# Altium schematic sheet A313_5.SchDoc
size 1071 x 817 mm
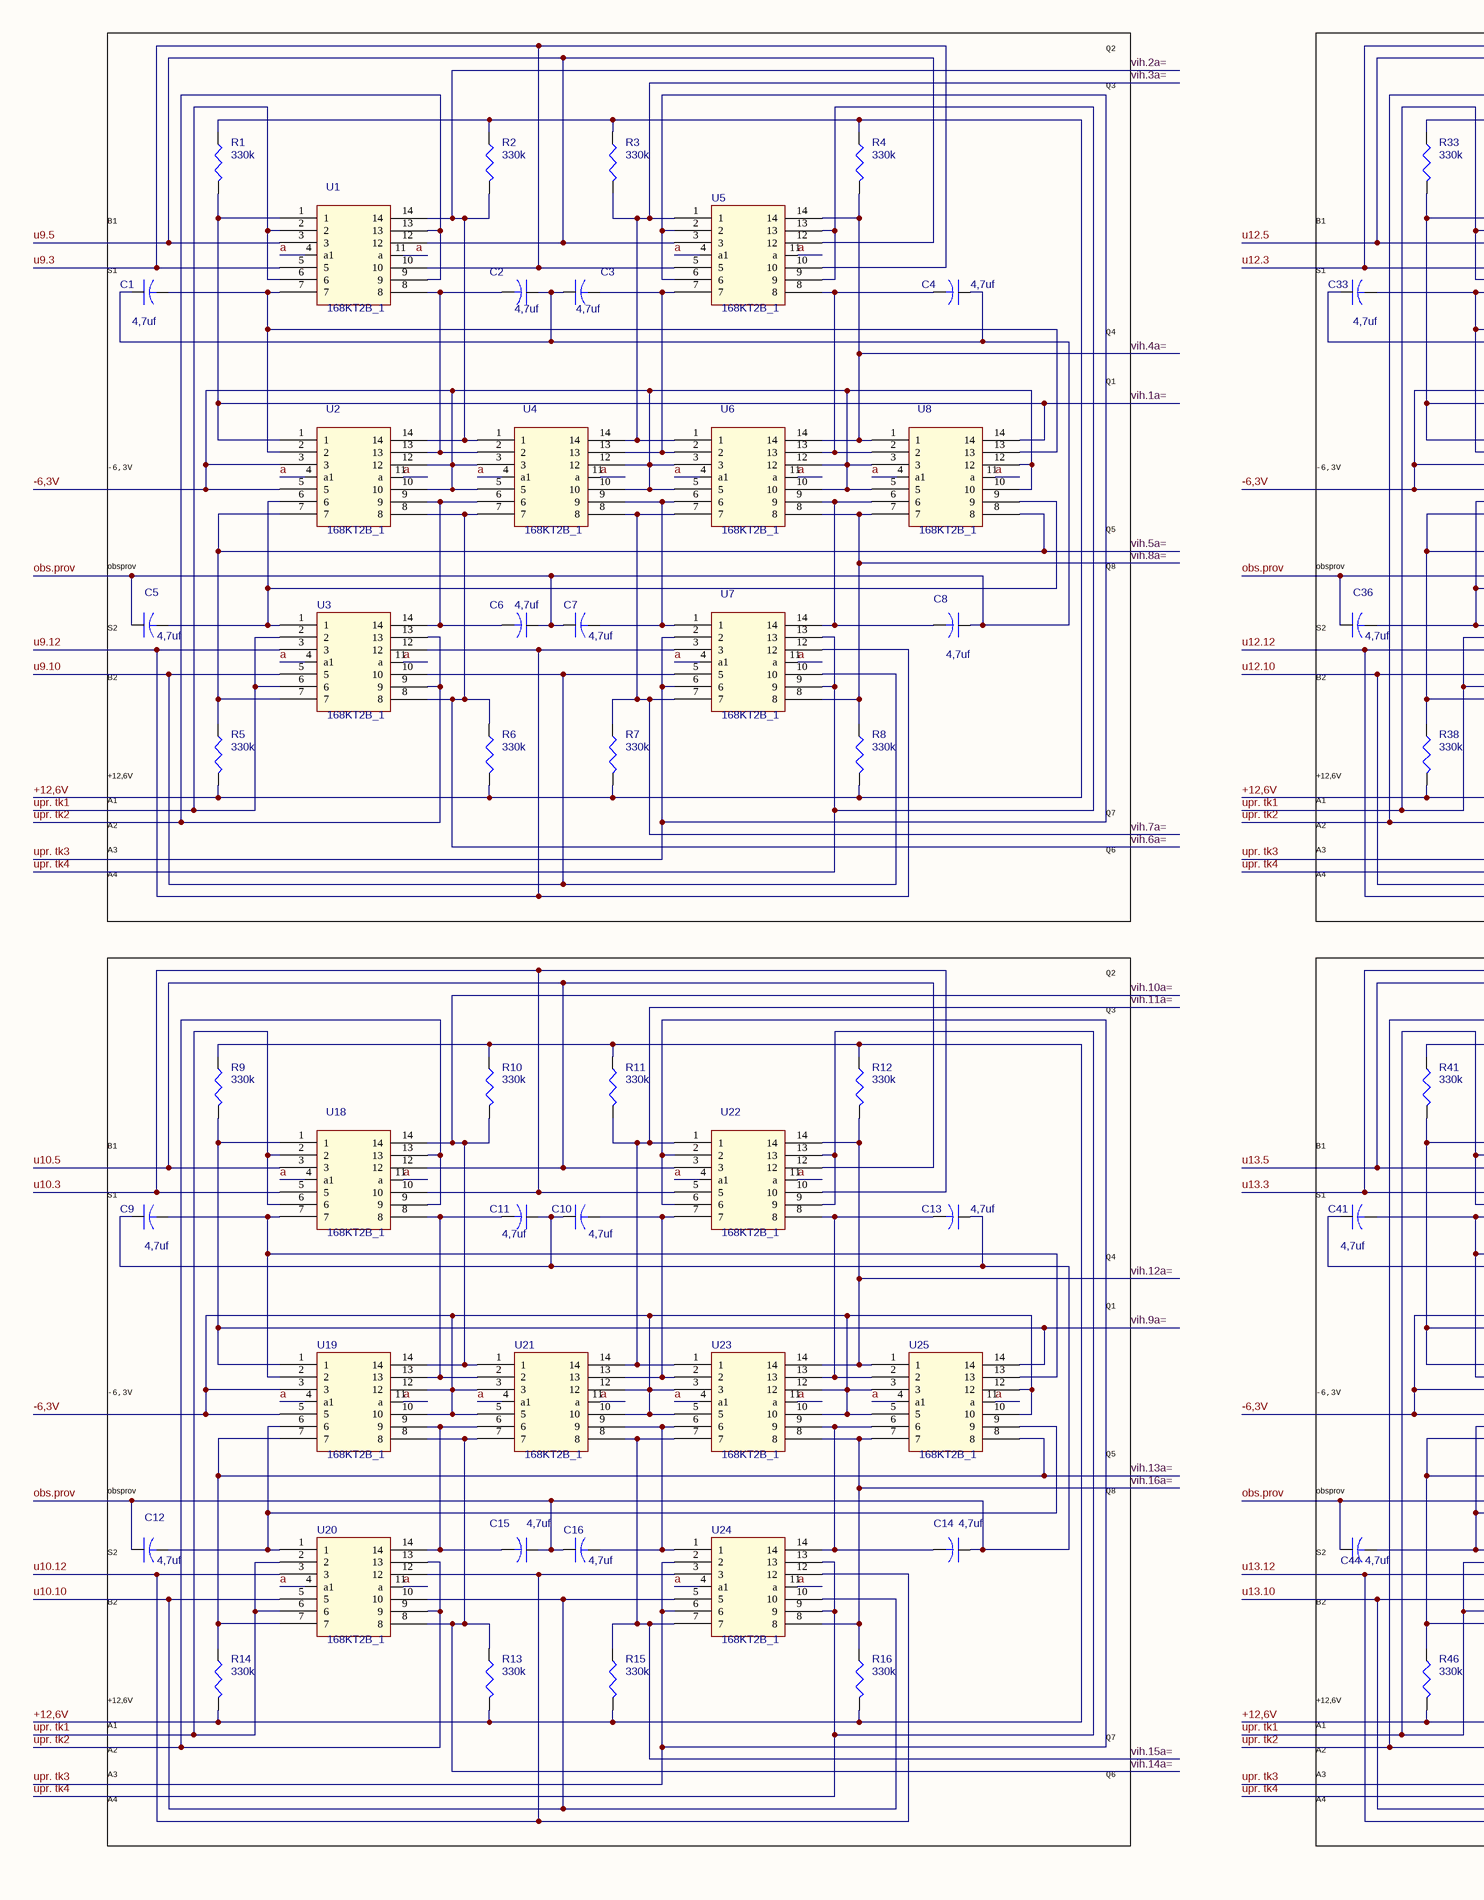
[diagram p0: A313_5.SchDoc, top left]
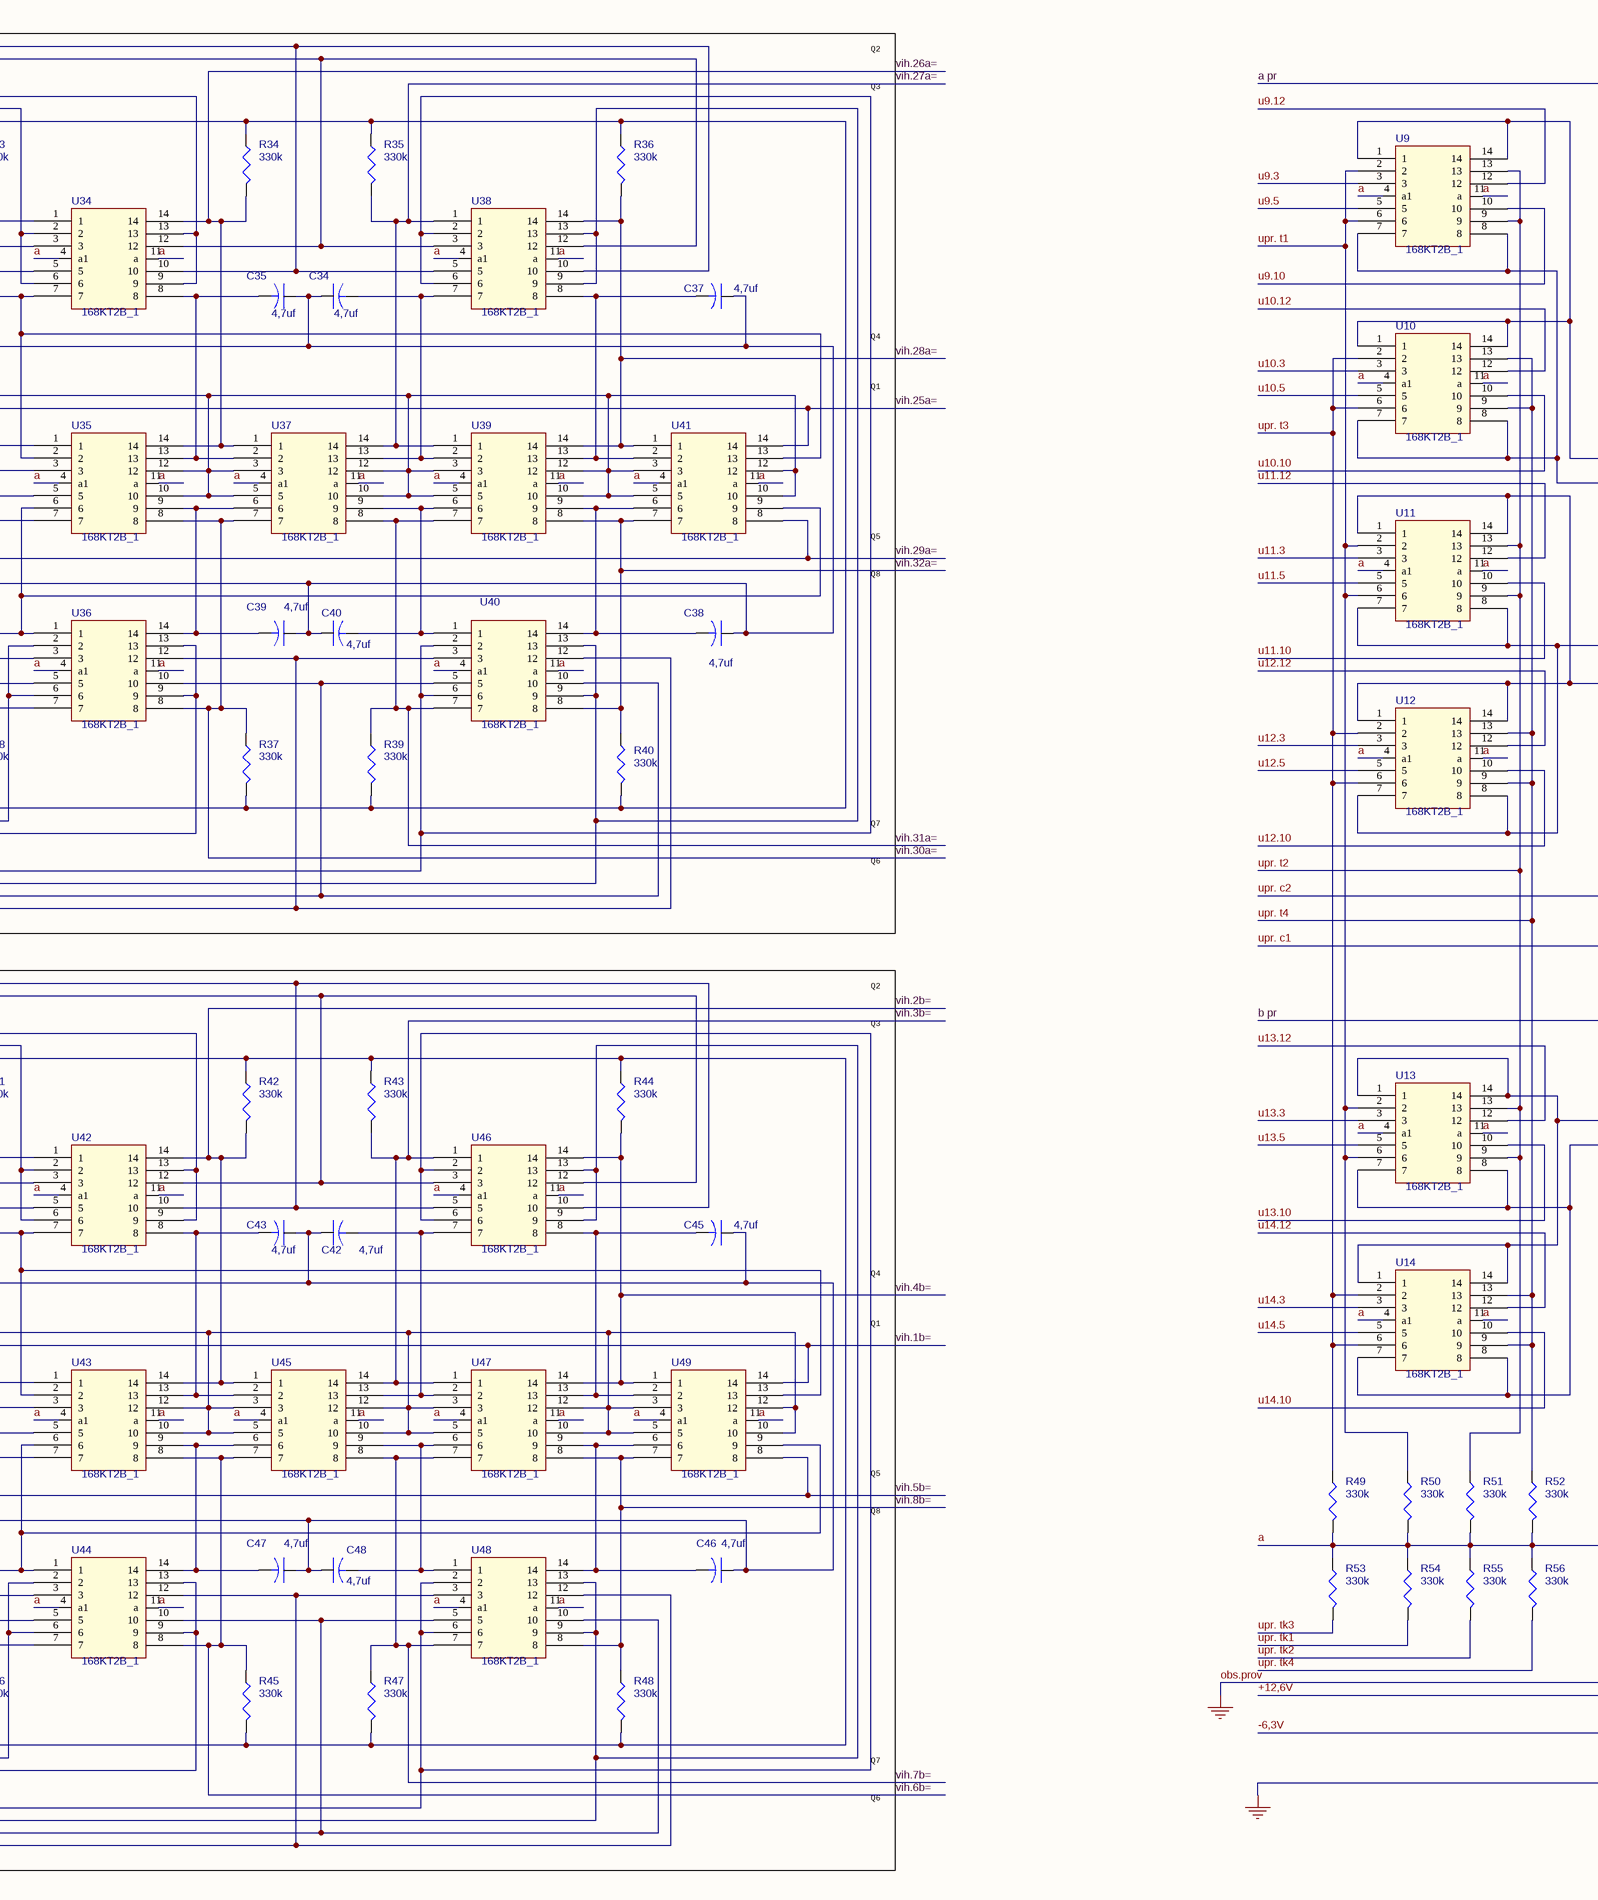
[diagram p1: A313_5.SchDoc, top middle]
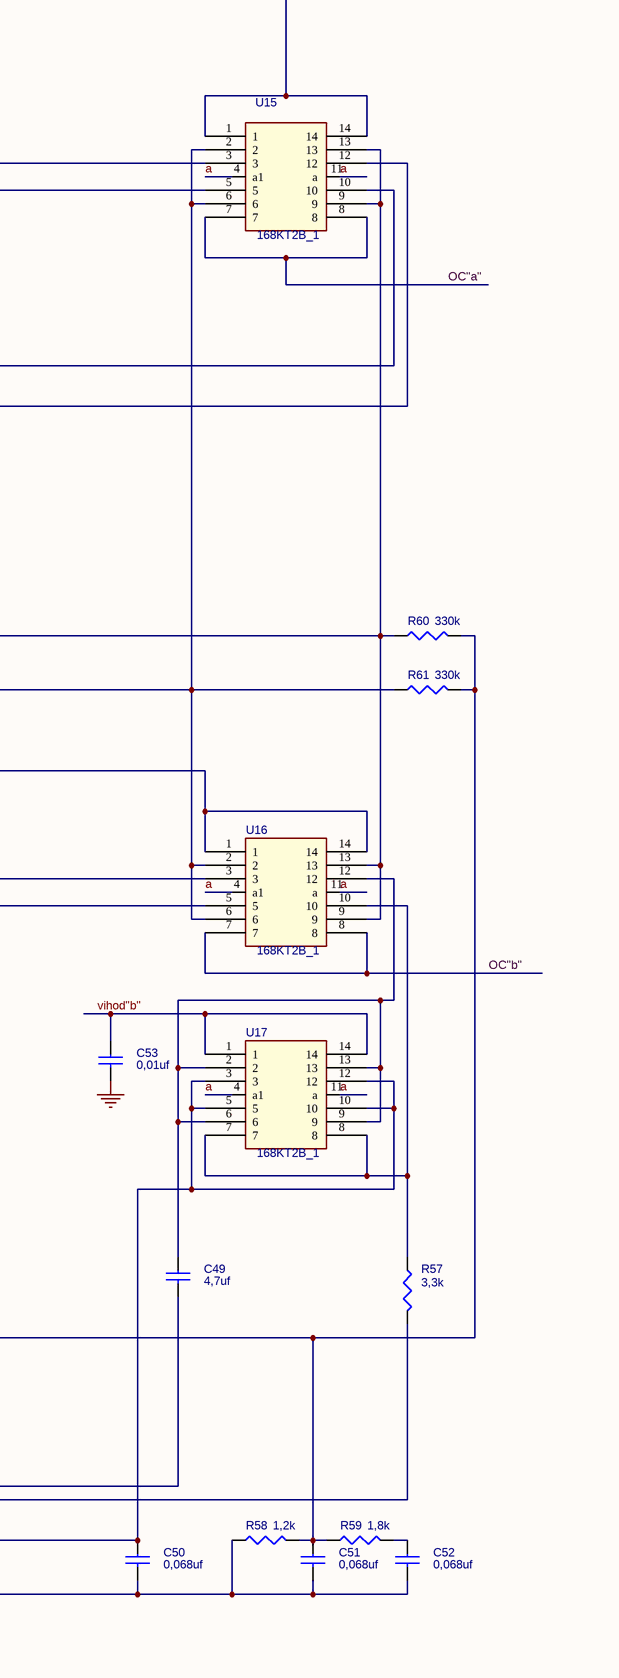
[diagram p2: A313_5.SchDoc, top right]
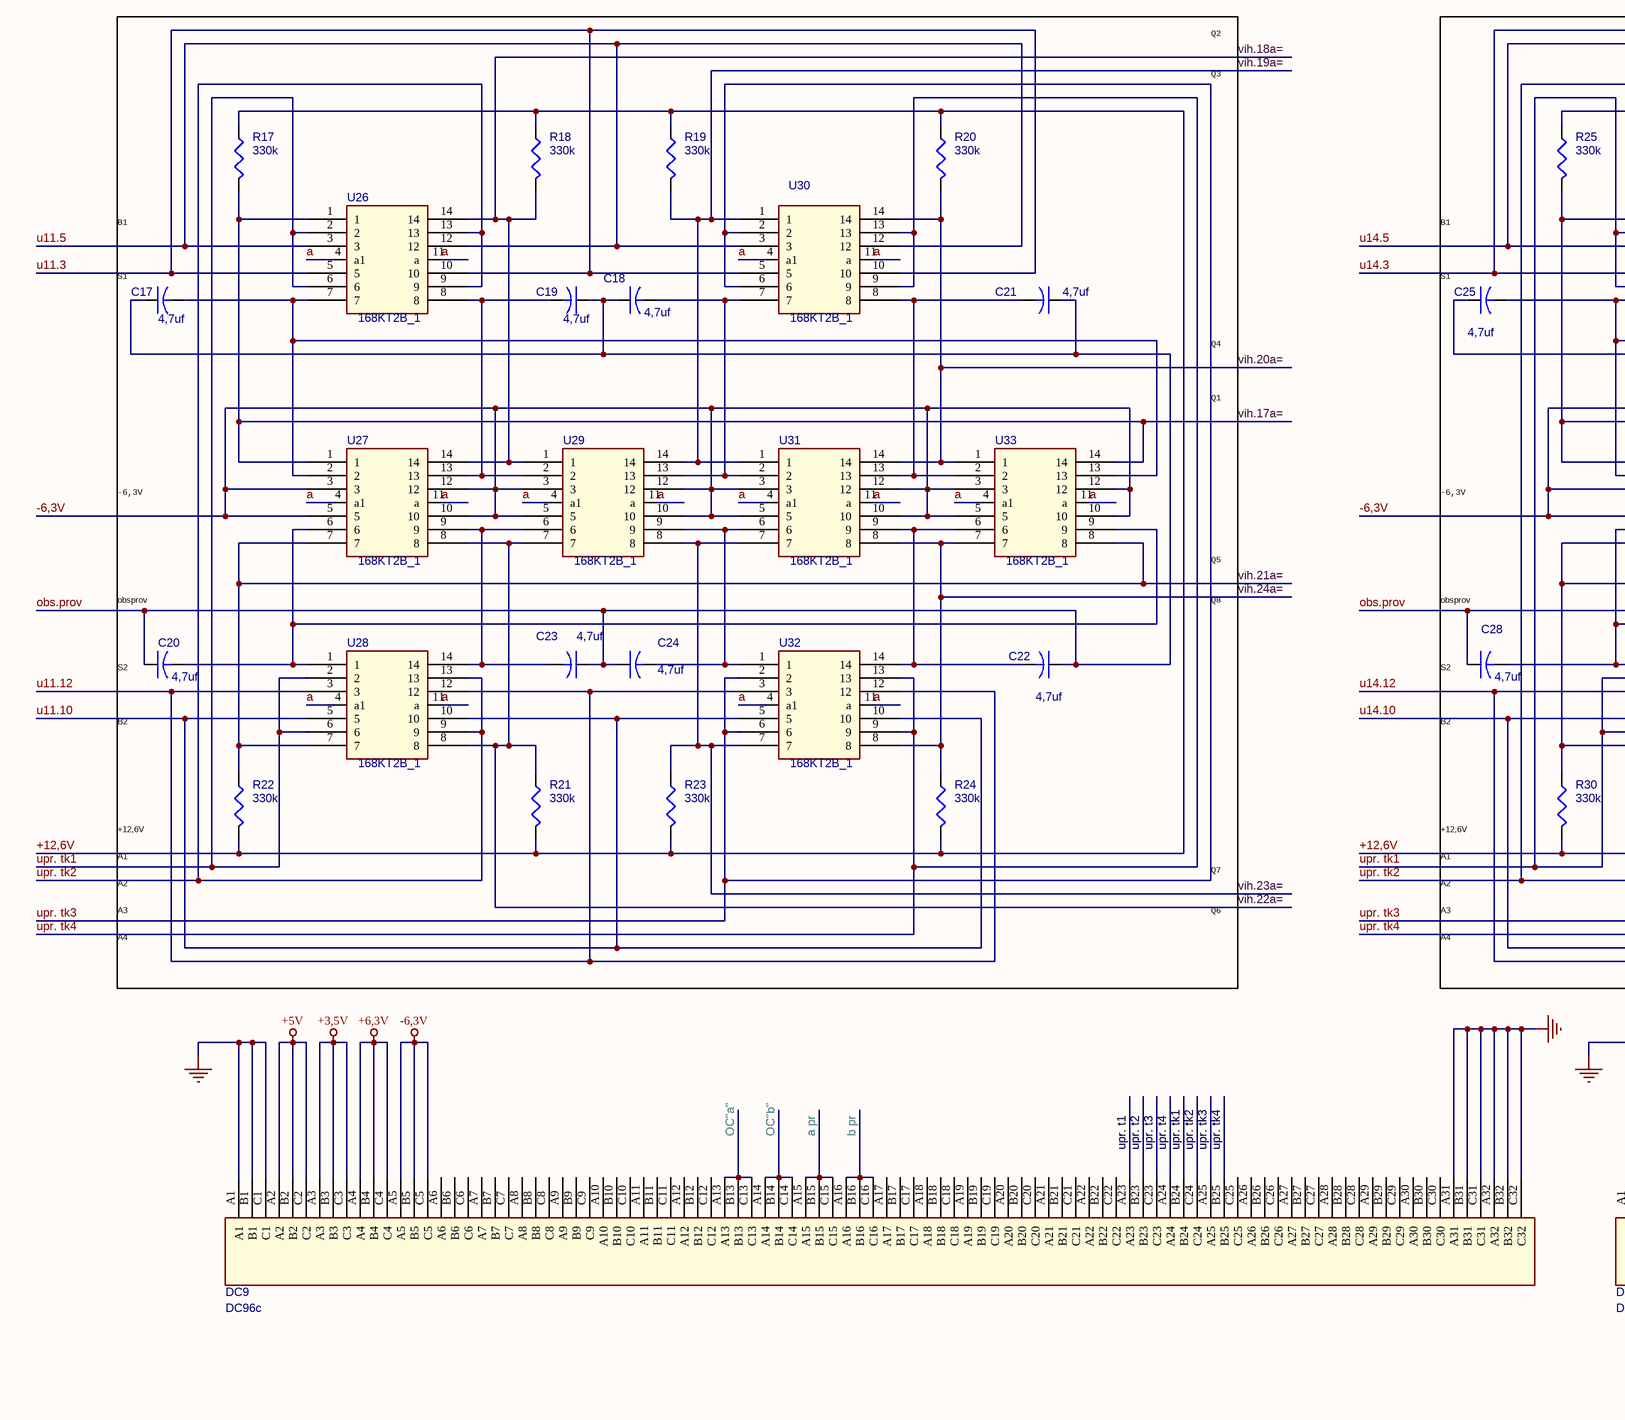
[diagram p3: A313_5.SchDoc, bottom left]
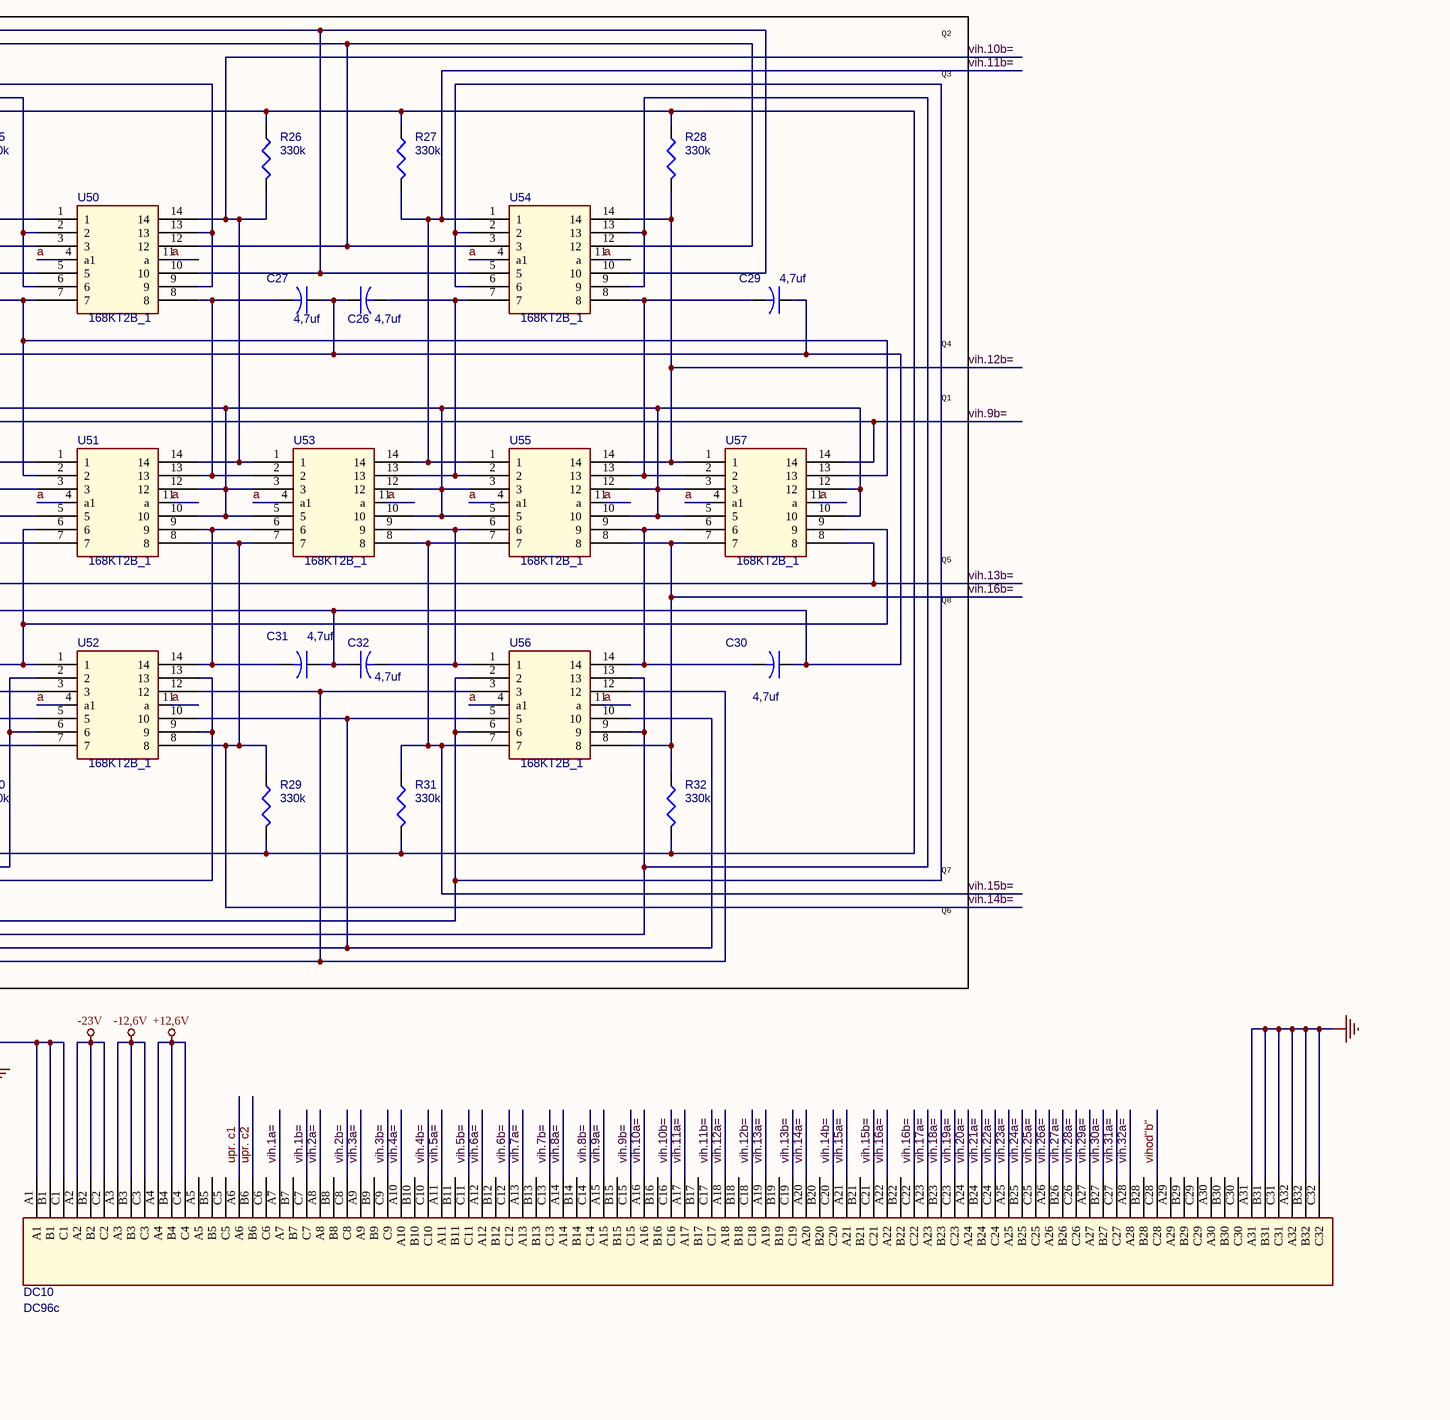
[diagram p4: A313_5.SchDoc, bottom middle]
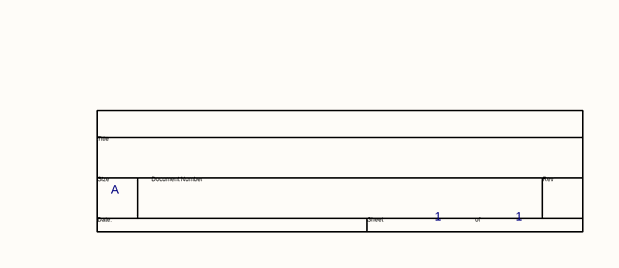
[diagram p5: A313_5.SchDoc, bottom right]

## Parts
*  Page Count: 1  Page Size: A  (hidden comment: TitleBlock0)  (graphical)
C1  4,7uf  [1206]
C2  4,7uf  [1206]
C3  4,7uf  [1206]
C4  4,7uf  [1206]
C5  4,7uf  [1206]
C6  4,7uf  [1206]
C7  4,7uf  [1206]
C8  4,7uf  [1206]
C9  4,7uf  [1206]
C10  4,7uf  [1206]
C11  4,7uf  [1206]
C12  4,7uf  [1206]
C13  4,7uf  [1206]
C14  4,7uf  [1206]
C15  4,7uf  [1206]
C16  4,7uf  [1206]
C17  4,7uf  [1206]
C18  4,7uf  [1206]
C19  4,7uf  [1206]
C20  4,7uf  [1206]
C21  4,7uf  [1206]
C22  4,7uf  [1206]
C23  4,7uf  [1206]
C24  4,7uf  [1206]
C25  4,7uf  [1206]
C26  4,7uf  [1206]
C27  4,7uf  [1206]
C28  4,7uf  [1206]
C29  4,7uf  [1206]
C30  4,7uf  [1206]
C31  4,7uf  [1206]
C32  4,7uf  [1206]
C33  4,7uf  [1206]
C34  4,7uf  [1206]
C35  4,7uf  [1206]
C36  4,7uf  [1206]
C37  4,7uf  [1206]
C38  4,7uf  [1206]
C39  4,7uf  [1206]
C40  4,7uf  [1206]
C41  4,7uf  [1206]
C42  4,7uf  [1206]
C43  4,7uf  [1206]
C44  4,7uf  [1206]
C45  4,7uf  [1206]
C46  4,7uf  [1206]
C47  4,7uf  [1206]
C48  4,7uf  [1206]
C49  4,7uf  [1206]
C50  0,068uf  [C0805]
C51  0,068uf  [C0805]
C52  0,068uf  [C0805]
C53  0,01uf  [C0805]
DC9  DC96c  [DC96c_DUC]
DC10  DC96c  [DC96c_DUC]
R1  330k  [6-0805_N]
R2  330k  [6-0805_N]
R3  330k  [6-0805_N]
R4  330k  [6-0805_N]
R5  330k  [6-0805_N]
R6  330k  [6-0805_N]
R7  330k  [6-0805_N]
R8  330k  [6-0805_N]
R9  330k  [6-0805_N]
R10  330k  [6-0805_N]
R11  330k  [6-0805_N]
R12  330k  [6-0805_N]
R13  330k  [6-0805_N]
R14  330k  [6-0805_N]
R15  330k  [6-0805_N]
R16  330k  [6-0805_N]
R17  330k  [6-0805_N]
R18  330k  [6-0805_N]
R19  330k  [6-0805_N]
R20  330k  [6-0805_N]
R21  330k  [6-0805_N]
R22  330k  [6-0805_N]
R23  330k  [6-0805_N]
R24  330k  [6-0805_N]
R25  330k  [6-0805_N]
R26  330k  [6-0805_N]
R27  330k  [6-0805_N]
R28  330k  [6-0805_N]
R29  330k  [6-0805_N]
R30  330k  [6-0805_N]
R31  330k  [6-0805_N]
R32  330k  [6-0805_N]
R33  330k  [6-0805_N]
R34  330k  [6-0805_N]
R35  330k  [6-0805_N]
R36  330k  [6-0805_N]
R37  330k  [6-0805_N]
R38  330k  [6-0805_N]
R39  330k  [6-0805_N]
R40  330k  [6-0805_N]
R41  330k  [6-0805_N]
R42  330k  [6-0805_N]
R43  330k  [6-0805_N]
R44  330k  [6-0805_N]
R45  330k  [6-0805_N]
R46  330k  [6-0805_N]
R47  330k  [6-0805_N]
R48  330k  [6-0805_N]
R49  330k  [6-0805_N]
R50  330k  [6-0805_N]
R51  330k  [6-0805_N]
R52  330k  [6-0805_N]
R53  330k  [6-0805_N]
R54  330k  [6-0805_N]
R55  330k  [6-0805_N]
R56  330k  [6-0805_N]
R57  3,3k  [6-0805_N]
R58  1,2k  [6-0805_N]
R59  1,8k  [6-0805_N]
R60  330k  [6-0805_N]
R61  330k  [6-0805_N]
U1  168KT2B_1  [168KT2B]
U2  168KT2B_1  [168KT2B]
U3  168KT2B_1  [168KT2B]
U4  168KT2B_1  [168KT2B]
U5  168KT2B_1  [168KT2B]
U6  168KT2B_1  [168KT2B]
U7  168KT2B_1  [168KT2B]
U8  168KT2B_1  [168KT2B]
U9  168KT2B_1  [168KT2B]
U10  168KT2B_1  [168KT2B]
U11  168KT2B_1  [168KT2B]
U12  168KT2B_1  [168KT2B]
U13  168KT2B_1  [168KT2B]
U14  168KT2B_1  [168KT2B]
U15  168KT2B_1  [168KT2B]
U16  168KT2B_1  [168KT2B]
U17  168KT2B_1  [168KT2B]
U18  168KT2B_1  [168KT2B]
U19  168KT2B_1  [168KT2B]
U20  168KT2B_1  [168KT2B]
U21  168KT2B_1  [168KT2B]
U22  168KT2B_1  [168KT2B]
U23  168KT2B_1  [168KT2B]
U24  168KT2B_1  [168KT2B]
U25  168KT2B_1  [168KT2B]
U26  168KT2B_1  [168KT2B]
U27  168KT2B_1  [168KT2B]
U28  168KT2B_1  [168KT2B]
U29  168KT2B_1  [168KT2B]
U30  168KT2B_1  [168KT2B]
U31  168KT2B_1  [168KT2B]
U32  168KT2B_1  [168KT2B]
U33  168KT2B_1  [168KT2B]
U34  168KT2B_1  [168KT2B]
U35  168KT2B_1  [168KT2B]
U36  168KT2B_1  [168KT2B]
U37  168KT2B_1  [168KT2B]
U38  168KT2B_1  [168KT2B]
U39  168KT2B_1  [168KT2B]
U40  168KT2B_1  [168KT2B]
U41  168KT2B_1  [168KT2B]
U42  168KT2B_1  [168KT2B]
U43  168KT2B_1  [168KT2B]
U44  168KT2B_1  [168KT2B]
U45  168KT2B_1  [168KT2B]
U46  168KT2B_1  [168KT2B]
U47  168KT2B_1  [168KT2B]
U48  168KT2B_1  [168KT2B]
U49  168KT2B_1  [168KT2B]
U50  168KT2B_1  [168KT2B]
U51  168KT2B_1  [168KT2B]
U52  168KT2B_1  [168KT2B]
U53  168KT2B_1  [168KT2B]
U54  168KT2B_1  [168KT2B]
U55  168KT2B_1  [168KT2B]
U56  168KT2B_1  [168KT2B]
U57  168KT2B_1  [168KT2B]

## Nets
+3,5V: DC9.A3 DC9.B3 DC9.C3
+5V: DC9.A2 DC9.B2 DC9.C2
+6,3V: DC9.A4 DC9.B4 DC9.C4
+12,6V: DC10.A4 DC10.B4 DC10.C4 R1.1 R2.1 R3.1 R4.1 R5.2 R6.2 R7.2 R8.2 R9.1 R10.1 R11.1 R12.1 R13.2 R14.2 R15.2 R16.2 R17.1 R18.1 R19.1 R20.1 R21.2 R22.2 R23.2 R24.2 R25.1 R26.1 R27.1 R28.1 R29.2 R30.2 R31.2 R32.2 R33.1 R34.1 R35.1 R36.1 R37.2 R38.2 R39.2 R40.2 R41.1 R42.1 R43.1 R44.1 R45.2 R46.2 R47.2 R48.2 R57.2
-6,3V: C50.1 DC9.A5 DC9.B5 DC9.C5 U2.3 U2.5 U2.10 U2.12 U4.3 U4.5 U4.10 U4.12 U6.3 U6.5 U6.10 U6.12 U8.3 U8.5 U8.10 U8.12 U17.3 U17.5 U17.10 U17.12 U19.3 U19.5 U19.10 U19.12 U21.3 U21.5 U21.10 U21.12 U23.3 U23.5 U23.10 U23.12 U25.3 U25.5 U25.10 U25.12 U27.3 U27.5 U27.10 U27.12 U29.3 U29.5 U29.10 U29.12 U31.3 U31.5 U31.10 U31.12 U33.3 U33.5 U33.10 U33.12 U35.3 U35.5 U35.10 U35.12 U37.3 U37.5 U37.10 U37.12 U39.3 U39.5 U39.10 U39.12 U41.3 U41.5 U41.10 U41.12 U43.3 U43.5 U43.10 U43.12 U45.3 U45.5 U45.10 U45.12 U47.3 U47.5 U47.10 U47.12 U49.3 U49.5 U49.10 U49.12 U51.3 U51.5 U51.10 U51.12 U53.3 U53.5 U53.10 U53.12 U55.3 U55.5 U55.10 U55.12 U57.3 U57.5 U57.10 U57.12
-12,6V: DC10.A3 DC10.B3 DC10.C3
-23V: DC10.A2 DC10.B2 DC10.C2
obs.prov: C1.1 C2.1 C3.1 C4.1 C5.1 C6.1 C7.1 C8.1 C9.1 C10.1 C11.1 C12.1 C13.1 C14.1 C15.1 C16.1 C17.1 C18.1 C19.1 C20.1 C21.1 C22.1 C23.1 C24.1 C25.1 C26.1 C27.1 C28.1 C29.1 C30.1 C31.1 C32.1 C33.1 C34.1 C35.1 C36.1 C37.1 C38.1 C39.1 C40.1 C41.1 C42.1 C43.1 C44.1 C45.1 C46.1 C47.1 C48.1 C49.2 C50.2 C51.2 C52.2 C53.2 DC9.A1 DC9.A31 DC9.A32 DC9.B1 DC9.B31 DC9.B32 DC9.C1 DC9.C31 DC9.C32 DC10.A1 DC10.A31 DC10.A32 DC10.B1 DC10.B31 DC10.B32 DC10.C1 DC10.C31 DC10.C32 R58.1  [also labelled GND]
a: C51.1 R49.2 R50.2 R51.2 R52.2 R53.1 R54.1 R55.1 R56.1 R58.2 R59.1 R60.2 R61.2 U1.4(a1) U1.11(a) U2.4(a1) U2.11(a) U3.4(a1) U3.11(a) U4.4(a1) U4.11(a) U5.4(a1) U5.11(a) U6.4(a1) U6.11(a) U7.4(a1) U7.11(a) U8.4(a1) U8.11(a) U9.4(a1) U9.11(a) U10.4(a1) U10.11(a) U11.4(a1) U11.11(a) U12.4(a1) U12.11(a) U13.4(a1) U13.11(a) U14.4(a1) U14.11(a) U15.4(a1) U15.11(a) U16.4(a1) U16.11(a) U17.4(a1) U17.11(a) U18.4(a1) U18.11(a) U19.4(a1) U19.11(a) U20.4(a1) U20.11(a) U21.4(a1) U21.11(a) U22.4(a1) U22.11(a) U23.4(a1) U23.11(a) U24.4(a1) U24.11(a) U25.4(a1) U25.11(a) U26.4(a1) U26.11(a) U27.4(a1) U27.11(a) U28.4(a1) U28.11(a) U29.4(a1) U29.11(a) U30.4(a1) U30.11(a) U31.4(a1) U31.11(a) U32.4(a1) U32.11(a) U33.4(a1) U33.11(a) U34.4(a1) U34.11(a) U35.4(a1) U35.11(a) U36.4(a1) U36.11(a) U37.4(a1) U37.11(a) U38.4(a1) U38.11(a) U39.4(a1) U39.11(a) U40.4(a1) U40.11(a) U41.4(a1) U41.11(a) U42.4(a1) U42.11(a) U43.4(a1) U43.11(a) U44.4(a1) U44.11(a) U45.4(a1) U45.11(a) U46.4(a1) U46.11(a) U47.4(a1) U47.11(a) U48.4(a1) U48.11(a) U49.4(a1) U49.11(a) U50.4(a1) U50.11(a) U51.4(a1) U51.11(a) U52.4(a1) U52.11(a) U53.4(a1) U53.11(a) U54.4(a1) U54.11(a) U55.4(a1) U55.11(a) U56.4(a1) U56.11(a) U57.4(a1) U57.11(a)
a pr: DC9.A15 DC9.B15 DC9.C15 U15.1 U15.14
b pr: DC9.A16 DC9.B16 DC9.C16 U16.1 U16.14
OC"a": DC9.A13 DC9.B13 DC9.C13 U15.7 U15.8
OC"b": DC9.A14 DC9.B14 DC9.C14 U16.7 U16.8
u9.3: U1.5 U1.10 U5.5 U5.10 U9.3
u9.5: U1.3 U1.12 U5.3 U5.12 U9.5
u9.10: U3.5 U3.10 U7.5 U7.10 U9.10
u9.12: U3.3 U3.12 U7.3 U7.12 U9.12
u10.3: U10.3 U18.5 U18.10 U22.5 U22.10
u10.5: U10.5 U18.3 U18.12 U22.3 U22.12
u10.10: U10.10 U20.5 U20.10 U24.5 U24.10
u10.12: U10.12 U20.3 U20.12 U24.3 U24.12
u11.3: U11.3 U26.5 U26.10 U30.5 U30.10
u11.5: U11.5 U26.3 U26.12 U30.3 U30.12
u11.10: U11.10 U28.5 U28.10 U32.5 U32.10
u11.12: U11.12 U28.3 U28.12 U32.3 U32.12
u12.3: U12.3 U34.5 U34.10 U38.5 U38.10
u12.5: U12.5 U34.3 U34.12 U38.3 U38.12
u12.10: U12.10 U36.5 U36.10 U40.5 U40.10
u12.12: U12.12 U36.3 U36.12 U40.3 U40.12
u13.3: U13.3 U42.5 U42.10 U46.5 U46.10
u13.5: U13.5 U42.3 U42.12 U46.3 U46.12
u13.10: U13.10 U44.5 U44.10 U48.5 U48.10
u13.12: U13.12 U44.3 U44.12 U48.3 U48.12
u14.3: U14.3 U50.5 U50.10 U54.5 U54.10
u14.5: U14.5 U50.3 U50.12 U54.3 U54.12
u14.10: U14.10 U52.5 U52.10 U56.5 U56.10
u14.12: U14.12 U52.3 U52.12 U56.3 U56.12
upr. c1: DC10.A6 R61.1 U15.2 U15.6 U16.2 U16.6
upr. c2: DC10.B6 R60.1 U15.9 U15.13 U16.9 U16.13
upr. t1: DC9.A23 R50.1 U9.2 U9.6 U11.2 U11.6 U13.2 U13.6
upr. t2: DC9.B23 R51.1 U9.9 U9.13 U11.9 U11.13 U13.9 U13.13
upr. t3: DC9.C23 R49.1 U10.2 U10.6 U12.2 U12.6 U14.2 U14.6
upr. t4: DC9.A24 R52.1 U10.9 U10.13 U12.9 U12.13 U14.9 U14.13
upr. tk1: DC9.B24 R54.2 U1.2 U1.6 U3.2 U3.6 U18.2 U18.6 U20.2 U20.6 U26.2 U26.6 U28.2 U28.6 U34.2 U34.6 U36.2 U36.6 U42.2 U42.6 U44.2 U44.6 U50.2 U50.6 U52.2 U52.6
upr. tk2: DC9.C24 R55.2 U1.9 U1.13 U3.9 U3.13 U18.9 U18.13 U20.9 U20.13 U26.9 U26.13 U28.9 U28.13 U34.9 U34.13 U36.9 U36.13 U42.9 U42.13 U44.9 U44.13 U50.9 U50.13 U52.9 U52.13
upr. tk3: DC9.A25 R53.2 U5.2 U5.6 U7.2 U7.6 U22.2 U22.6 U24.2 U24.6 U30.2 U30.6 U32.2 U32.6 U38.2 U38.6 U40.2 U40.6 U46.2 U46.6 U48.2 U48.6 U54.2 U54.6 U56.2 U56.6
upr. tk4: DC9.B25 R56.2 U5.9 U5.13 U7.9 U7.13 U22.9 U22.13 U24.9 U24.13 U30.9 U30.13 U32.9 U32.13 U38.9 U38.13 U40.9 U40.13 U46.9 U46.13 U48.9 U48.13 U54.9 U54.13 U56.9 U56.13
vih.1a=: DC10.A7 R1.2 U1.1 U2.1 U8.14
vih.1b=: DC10.C7 R41.2 U42.1 U43.1 U49.14
vih.2a=: DC10.A8 R2.2 U1.14 U2.14 U4.1
vih.2b=: DC10.C8 R42.2 U42.14 U43.14 U45.1
vih.3a=: DC10.A9 R3.2 U4.14 U5.1 U6.1
vih.3b=: DC10.C9 R43.2 U45.14 U46.1 U47.1
vih.4a=: DC10.A10 R4.2 U5.14 U6.14 U8.1
vih.4b=: DC10.C10 R44.2 U46.14 U47.14 U49.1
vih.5a=: DC10.A11 R5.1 U2.7 U3.7 U8.8
vih.5b=: DC10.C11 R46.1 U43.7 U44.7 U49.8
vih.6a=: DC10.A12 R6.1 U2.8 U3.8 U4.7
vih.6b=: DC10.C12 R45.1 U43.8 U44.8 U45.7
vih.7a=: DC10.A13 R7.1 U4.8 U6.7 U7.7
vih.7b=: DC10.C13 R47.1 U45.8 U47.7 U48.7
vih.8a=: DC10.A14 R8.1 U6.8 U7.8 U8.7
vih.8b=: DC10.C14 R48.1 U47.8 U48.8 U49.7
vih.9a=: DC10.A15 R9.2 U18.1 U19.1 U25.14
vih.9b=: DC10.C15 R25.2 U50.1 U51.1 U57.14
vih.10a=: DC10.A16 R10.2 U18.14 U19.14 U21.1
vih.10b=: DC10.C16 R26.2 U50.14 U51.14 U53.1
vih.11a=: DC10.A17 R11.2 U21.14 U22.1 U23.1
vih.11b=: DC10.C17 R27.2 U53.14 U54.1 U55.1
vih.12a=: DC10.A18 R12.2 U22.14 U23.14 U25.1
vih.12b=: DC10.C18 R28.2 U54.14 U55.14 U57.1
vih.13a=: DC10.A19 R14.1 U19.7 U20.7 U25.8
vih.13b=: DC10.C19 R30.1 U51.7 U52.7 U57.8
vih.14a=: DC10.A20 R13.1 U19.8 U20.8 U21.7
vih.14b=: DC10.C20 R29.1 U51.8 U52.8 U53.7
vih.15a=: DC10.A21 R15.1 U21.8 U23.7 U24.7
vih.15b=: DC10.C21 R31.1 U53.8 U55.7 U56.7
vih.16a=: DC10.A22 R16.1 U23.8 U24.8 U25.7
vih.16b=: DC10.C22 R32.1 U55.8 U56.8 U57.7
vih.17a=: DC10.A23 R17.2 U26.1 U27.1 U33.14
vih.18a=: DC10.B23 R18.2 U26.14 U27.14 U29.1
vih.19a=: DC10.C23 R19.2 U29.14 U30.1 U31.1
vih.20a=: DC10.A24 R20.2 U30.14 U31.14 U33.1
vih.21a=: DC10.B24 R22.1 U27.7 U28.7 U33.8
vih.22a=: DC10.C24 R21.1 U27.8 U28.8 U29.7
vih.23a=: DC10.A25 R23.1 U29.8 U31.7 U32.7
vih.24a=: DC10.B25 R24.1 U31.8 U32.8 U33.7
vih.25a=: DC10.C25 R33.2 U34.1 U35.1 U41.14
vih.26a=: DC10.A26 R34.2 U34.14 U35.14 U37.1
vih.27a=: DC10.B26 R35.2 U37.14 U38.1 U39.1
vih.28a=: DC10.C26 R36.2 U38.14 U39.14 U41.1
vih.29a=: DC10.A27 R38.1 U35.7 U36.7 U41.8
vih.30a=: DC10.B27 R37.1 U35.8 U36.8 U37.7
vih.31a=: DC10.C27 R39.1 U37.8 U39.7 U40.7
vih.32a=: DC10.A28 R40.1 U39.8 U40.8 U41.7
vihod"b": C53.1 DC10.C28 U17.1 U17.14
NetC1_2: C1.2 U1.7 U2.2 U8.13
NetC2_2: C2.2 U1.8 U2.13 U4.2
NetC3_2: C3.2 U4.13 U5.7 U6.2
NetC4_2: C4.2 U5.8 U6.13 U8.2
NetC5_2: C5.2 U2.6 U3.1 U8.9
NetC6_2: C6.2 U2.9 U3.14 U4.6
NetC7_2: C7.2 U4.9 U6.6 U7.1
NetC8_2: C8.2 U6.9 U7.14 U8.6
NetC9_2: C9.2 U18.7 U19.2 U25.13
NetC10_2: C10.2 U21.13 U22.7 U23.2
NetC11_2: C11.2 U18.8 U19.13 U21.2
NetC12_2: C12.2 U19.6 U20.1 U25.9
NetC13_2: C13.2 U22.8 U23.13 U25.2
NetC14_2: C14.2 U23.9 U24.14 U25.6
NetC15_2: C15.2 U19.9 U20.14 U21.6
NetC16_2: C16.2 U21.9 U23.6 U24.1
NetC17_2: C17.2 U26.7 U27.2 U33.13
NetC18_2: C18.2 U29.13 U30.7 U31.2
NetC19_2: C19.2 U26.8 U27.13 U29.2
NetC20_2: C20.2 U27.6 U28.1 U33.9
NetC21_2: C21.2 U30.8 U31.13 U33.2
NetC22_2: C22.2 U31.9 U32.14 U33.6
NetC23_2: C23.2 U27.9 U28.14 U29.6
NetC24_2: C24.2 U29.9 U31.6 U32.1
NetC25_2: C25.2 U50.7 U51.2 U57.13
NetC26_2: C26.2 U53.13 U54.7 U55.2
NetC27_2: C27.2 U50.8 U51.13 U53.2
NetC28_2: C28.2 U51.6 U52.1 U57.9
NetC29_2: C29.2 U54.8 U55.13 U57.2
NetC30_2: C30.2 U55.9 U56.14 U57.6
NetC31_2: C31.2 U51.9 U52.14 U53.6
NetC32_2: C32.2 U53.9 U55.6 U56.1
NetC33_2: C33.2 U34.7 U35.2 U41.13
NetC34_2: C34.2 U37.13 U38.7 U39.2
NetC35_2: C35.2 U34.8 U35.13 U37.2
NetC36_2: C36.2 U35.6 U36.1 U41.9
NetC37_2: C37.2 U38.8 U39.13 U41.2
NetC38_2: C38.2 U39.9 U40.14 U41.6
NetC39_2: C39.2 U35.9 U36.14 U37.6
NetC40_2: C40.2 U37.9 U39.6 U40.1
NetC41_2: C41.2 U42.7 U43.2 U49.13
NetC42_2: C42.2 U45.13 U46.7 U47.2
NetC43_2: C43.2 U42.8 U43.13 U45.2
NetC44_2: C44.2 U43.6 U44.1 U49.9
NetC45_2: C45.2 U46.8 U47.13 U49.2
NetC46_2: C46.2 U47.9 U48.14 U49.6
NetC47_2: C47.2 U43.9 U44.14 U45.6
NetC48_2: C48.2 U45.9 U47.6 U48.1
NetC49_1: C49.1 U16.12 U17.2 U17.6 U17.9 U17.13
NetC52_1: C52.1 R59.2
NetR57_1: R57.1 U16.10 U17.7 U17.8
NetU9_1: U9.1 U9.14 U10.1 U10.14 U15.3
NetU9_7: U9.7 U9.8 U10.7 U10.8 U15.5
NetU11_1: U11.1 U11.14 U12.1 U12.14 U15.12
NetU11_7: U11.7 U11.8 U12.7 U12.8 U15.10
NetU13_1: U13.1 U13.14 U14.1 U14.14 U16.3
NetU13_7: U13.7 U13.8 U14.7 U14.8 U16.5

Not connected (* = marked no-connect by the designer): DC9 A6 A7 A8 A9 A10 A11 A12 A17 A18 A19 A20 A21 A22 A26 A27 A28 A29 A30 B6 B7 B8 B9 B10 B11 B12 B17 B18 B19 B20 B21 B22 B26 B27 B28 B29 B30 C6 C7 C8 C9 C10 C11 C12 C17 C18 C19 C20 C21 C22 C25 C26 C27 C28 C29 C30; DC10 A5 A29 A30 B5 B7 B8 B9 B10 B11 B12 B13 B14 B15 B16 B17 B18 B19 B20 B21 B22 B28 B29 B30 C5 C6 C29 C30

## Notes on the sheet
- Q2
- Q3
- B1
- (near C1) S1
- (near C33) S1
- Q4
- Q1
- -6,3V
- Q5
- obsprov
- Q8
- (near C5) S2
- B2
- (near C36) S2
- +12,6V
- A1
- A2
- A3
- Q7
- Q6
- A4
- (near C9) S1
- (near C41) S1
- (near C12) S2
- (near C44) S2
- (near C17) S1
- (near C25) S1
- (near C20) S2
- (near C28) S2
- (in symbol TitleBlock0) Title; Size; Document Number; Rev; Date:; Sheet; of

## Library data of the parts
C1-C48 = CAP
C49-C53 = CAP NP
R1-R61 = R
U1-U5 U7-U12 U14-U57 = 168KT2B_4
U6 = 168KT2B_5
U13 = 168KT2B_7
* = TitleBlock0: Page Number: 1; Page Create Date: March  8, 1995